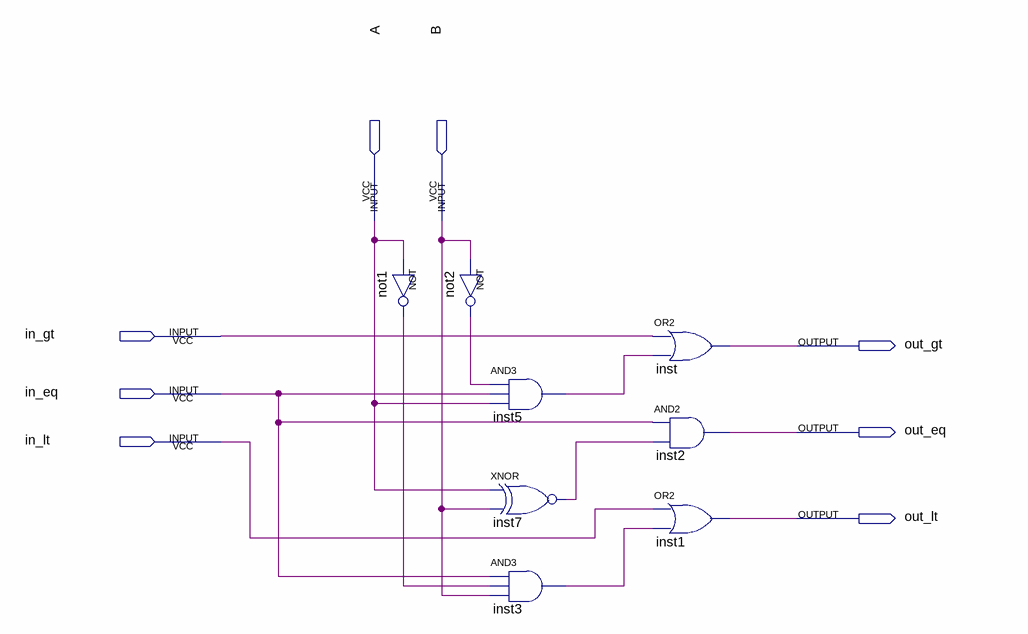
[diagram p0: schematic sheet]
// Quartus schematic Comparator.bdf as structural Verilog: 8 symbols, 8 pins
module Comparator (
  input  A,
  input  B,
  input  in_gt,
  input  in_eq,
  input  in_lt,
  output out_gt,
  output out_eq,
  output out_lt
);

  wire inst3_out, inst5_out, inst7_out, not1_out, not2_out;

  not not1 (not1_out, A);
  not not2 (not2_out, B);
  and inst5 (inst5_out, not2_out, in_eq, A);
  xnor inst7 (inst7_out, A, B);
  and inst3 (inst3_out, in_eq, not1_out, B);
  or inst (out_gt, in_gt, inst5_out);
  and inst2 (out_eq, in_eq, inst7_out);
  or inst1 (out_lt, in_lt, inst3_out);
endmodule
